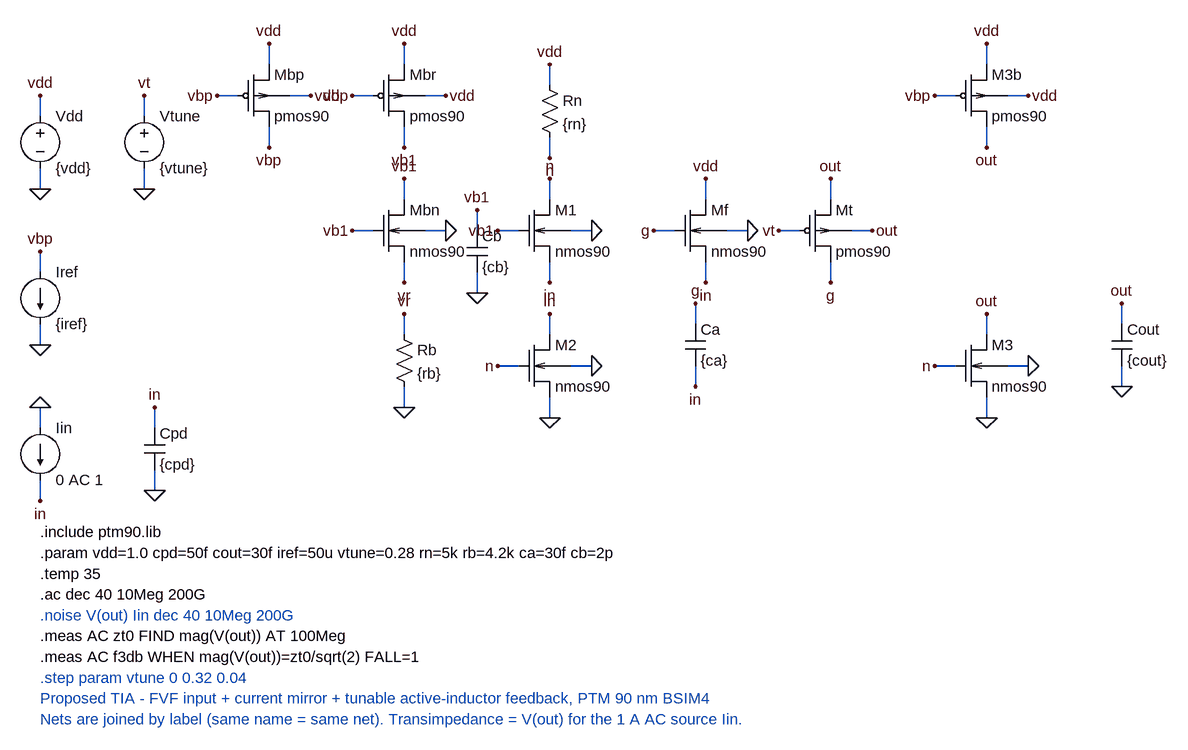
[diagram p0: schematic proposed_tia.asc]
proposed_tia.asc, the LTspice schematic file:
Version 4
SHEET 1 2200 1200
WIRE -720 80 -720 48
WIRE -720 160 -720 192
WIRE -560 80 -560 48
WIRE -560 160 -560 192
WIRE -720 320 -720 288
WIRE -720 400 -720 432
WIRE -368 96 -368 128
WIRE -416 48 -448 48
WIRE -368 0 -368 -32
WIRE -336 48 -304 48
WIRE -160 96 -160 128
WIRE -208 48 -240 48
WIRE -160 0 -160 -32
WIRE -128 48 -96 48
WIRE -160 208 -160 176
WIRE -208 256 -240 256
WIRE -160 304 -160 336
WIRE -128 256 -96 256
WIRE -160 416 -160 384
WIRE -160 496 -160 528
WIRE -48 256 -48 224
WIRE -48 320 -48 352
WIRE 64 32 64 0
WIRE 64 112 64 144
WIRE 64 208 64 176
WIRE 16 256 -16 256
WIRE 64 304 64 336
WIRE 96 256 128 256
WIRE 64 416 64 384
WIRE 16 464 -16 464
WIRE 64 512 64 544
WIRE 96 464 128 464
WIRE 736 416 736 384
WIRE 688 464 656 464
WIRE 736 512 736 544
WIRE 768 464 800 464
WIRE 736 96 736 128
WIRE 688 48 656 48
WIRE 736 0 736 -32
WIRE 768 48 800 48
WIRE 304 208 304 176
WIRE 256 256 224 256
WIRE 304 304 304 336
WIRE 336 256 368 256
WIRE 496 304 496 336
WIRE 448 256 416 256
WIRE 496 208 496 176
WIRE 528 256 560 256
WIRE 288 400 288 368
WIRE 288 464 288 496
WIRE -544 560 -544 528
WIRE -544 624 -544 656
WIRE 944 400 944 368
WIRE 944 464 944 496
WIRE -720 560 -720 528
WIRE -720 640 -720 672
FLAG -720 48 vdd
FLAG -720 192 0
FLAG -560 48 vt
FLAG -560 192 0
FLAG -720 288 vbp
FLAG -720 432 0
FLAG -368 128 vbp
FLAG -448 48 vbp
FLAG -368 -32 vdd
FLAG -304 48 vdd
FLAG -160 128 vb1
FLAG -240 48 vbp
FLAG -160 -32 vdd
FLAG -96 48 vdd
FLAG -160 176 vb1
FLAG -240 256 vb1
FLAG -160 336 vr
FLAG -96 256 0
FLAG -160 384 vr
FLAG -160 528 0
FLAG -48 224 vb1
FLAG -48 352 0
FLAG 64 0 vdd
FLAG 64 144 n
FLAG 64 176 n
FLAG -16 256 vb1
FLAG 64 336 in
FLAG 128 256 0
FLAG 64 384 in
FLAG -16 464 n
FLAG 64 544 0
FLAG 128 464 0
FLAG 736 384 out
FLAG 656 464 n
FLAG 736 544 0
FLAG 800 464 0
FLAG 736 128 out
FLAG 656 48 vbp
FLAG 736 -32 vdd
FLAG 800 48 vdd
FLAG 304 176 vdd
FLAG 224 256 g
FLAG 304 336 in
FLAG 368 256 0
FLAG 496 336 g
FLAG 416 256 vt
FLAG 496 176 out
FLAG 560 256 out
FLAG 288 368 g
FLAG 288 496 in
FLAG -544 528 in
FLAG -544 656 0
FLAG 944 368 out
FLAG 944 496 0
FLAG -720 528 0
FLAG -720 672 in
SYMBOL voltage -720 64 R0
SYMATTR InstName Vdd
SYMATTR Value {vdd}
SYMBOL voltage -560 64 R0
SYMATTR InstName Vtune
SYMATTR Value {vtune}
SYMBOL current -720 320 R0
SYMATTR InstName Iref
SYMATTR Value {iref}
SYMBOL tia_pmos4 -416 0 R0
SYMATTR InstName Mbp
SYMATTR Value pmos90
SYMATTR Value2 l=180n w=2u ad=0.4p as=0.4p pd=4.4u ps=4.4u
SYMBOL tia_pmos4 -208 0 R0
SYMATTR InstName Mbr
SYMATTR Value pmos90
SYMATTR Value2 l=180n w=2u ad=0.4p as=0.4p pd=4.4u ps=4.4u
SYMBOL tia_nmos4 -208 208 R0
SYMATTR InstName Mbn
SYMATTR Value nmos90
SYMATTR Value2 l=90n w=0.4u ad=0.08p as=0.08p pd=1.2u ps=1.2u
SYMBOL res -176 400 R0
SYMATTR InstName Rb
SYMATTR Value {rb}
SYMBOL cap -64 256 R0
SYMATTR InstName Cb
SYMATTR Value {cb}
SYMBOL res 48 16 R0
SYMATTR InstName Rn
SYMATTR Value {rn}
SYMBOL tia_nmos4 16 208 R0
SYMATTR InstName M1
SYMATTR Value nmos90
SYMATTR Value2 l=90n w=4.5u ad=0.9p as=0.9p pd=9.4u ps=9.4u
SYMBOL tia_nmos4 16 416 R0
SYMATTR InstName M2
SYMATTR Value nmos90
SYMATTR Value2 l=90n w=3.5u ad=0.7p as=0.7p pd=7.4u ps=7.4u
SYMBOL tia_nmos4 688 416 R0
SYMATTR InstName M3
SYMATTR Value nmos90
SYMATTR Value2 l=90n w=7u ad=1.4p as=1.4p pd=14.4u ps=14.4u
SYMBOL tia_pmos4 688 0 R0
SYMATTR InstName M3b
SYMATTR Value pmos90
SYMATTR Value2 l=180n w=28u ad=5.6p as=5.6p pd=56.4u ps=56.4u
SYMBOL tia_nmos4 256 208 R0
SYMATTR InstName Mf
SYMATTR Value nmos90
SYMATTR Value2 l=90n w=3.5u ad=0.7p as=0.7p pd=7.4u ps=7.4u
SYMBOL tia_pmos4 448 208 R0
SYMATTR InstName Mt
SYMATTR Value pmos90
SYMATTR Value2 l=90n w=12u ad=2.4p as=2.4p pd=24.4u ps=24.4u
SYMBOL cap 272 400 R0
SYMATTR InstName Ca
SYMATTR Value {ca}
SYMBOL cap -560 560 R0
SYMATTR InstName Cpd
SYMATTR Value {cpd}
SYMBOL cap 928 400 R0
SYMATTR InstName Cout
SYMATTR Value {cout}
SYMBOL current -720 560 R0
SYMATTR InstName Iin
SYMATTR Value 0 AC 1
TEXT -720 720 Left 2 !.include ptm90.lib
TEXT -720 752 Left 2 !.param vdd=1.0 cpd=50f cout=30f iref=50u vtune=0.28 rn=5k rb=4.2k ca=30f cb=2p
TEXT -720 784 Left 2 !.temp 35
TEXT -720 816 Left 2 !.ac dec 40 10Meg 200G
TEXT -720 848 Left 2 ;.noise V(out) Iin dec 40 10Meg 200G
TEXT -720 880 Left 2 !.meas AC zt0 FIND mag(V(out)) AT 100Meg
TEXT -720 912 Left 2 !.meas AC f3db WHEN mag(V(out))=zt0/sqrt(2) FALL=1
TEXT -720 944 Left 2 ;.step param vtune 0 0.32 0.04
TEXT -720 976 Left 2 ;Proposed TIA - FVF input + current mirror + tunable active-inductor feedback, PTM 90 nm BSIM4
TEXT -720 1008 Left 2 ;Nets are joined by label (same name = same net). Transimpedance = V(out) for the 1 A AC source Iin.

The netlist it stands for:
* proposed_tia.asc
Vdd vdd 0 {vdd}
Vtune vt 0 {vtune}
Iref vbp 0 {iref}
Mbp vbp vbp vdd vdd pmos90 l=180n w=2u ad=0.4p as=0.4p pd=4.4u ps=4.4u
Mbr vb1 vbp vdd vdd pmos90 l=180n w=2u ad=0.4p as=0.4p pd=4.4u ps=4.4u
Mbn vb1 vb1 vr 0 nmos90 l=90n w=0.4u ad=0.08p as=0.08p pd=1.2u ps=1.2u
Rb vr 0 {rb}
Cb vb1 0 {cb}
Rn vdd n {rn}
M1 n vb1 in 0 nmos90 l=90n w=4.5u ad=0.9p as=0.9p pd=9.4u ps=9.4u
M2 in n 0 0 nmos90 l=90n w=3.5u ad=0.7p as=0.7p pd=7.4u ps=7.4u
M3 out n 0 0 nmos90 l=90n w=7u ad=1.4p as=1.4p pd=14.4u ps=14.4u
M3b out vbp vdd vdd pmos90 l=180n w=28u ad=5.6p as=5.6p pd=56.4u ps=56.4u
Mf vdd g in 0 nmos90 l=90n w=3.5u ad=0.7p as=0.7p pd=7.4u ps=7.4u
Mt g vt out out pmos90 l=90n w=12u ad=2.4p as=2.4p pd=24.4u ps=24.4u
Ca g in {ca}
Cpd in 0 {cpd}
Cout out 0 {cout}
Iin 0 in 0 AC 1
.model NMOS NMOS
.model PMOS PMOS
.lib standard.mos
.include ptm90.lib
.param vdd=1.0 cpd=50f cout=30f iref=50u vtune=0.28 rn=5k rb=4.2k ca=30f cb=2p
.temp 35
.ac dec 40 10Meg 200G
* .noise V(out) Iin dec 40 10Meg 200G
.meas AC zt0 FIND mag(V(out)) AT 100Meg
.meas AC f3db WHEN mag(V(out))=zt0/sqrt(2) FALL=1
* .step param vtune 0 0.32 0.04
* Proposed TIA - FVF input + current mirror + tunable active-inductor feedback, PTM 90 nm BSIM4
* Nets are joined by label (same name = same net). Transimpedance = V(out) for the 1 A AC source Iin.
.backanno
.end